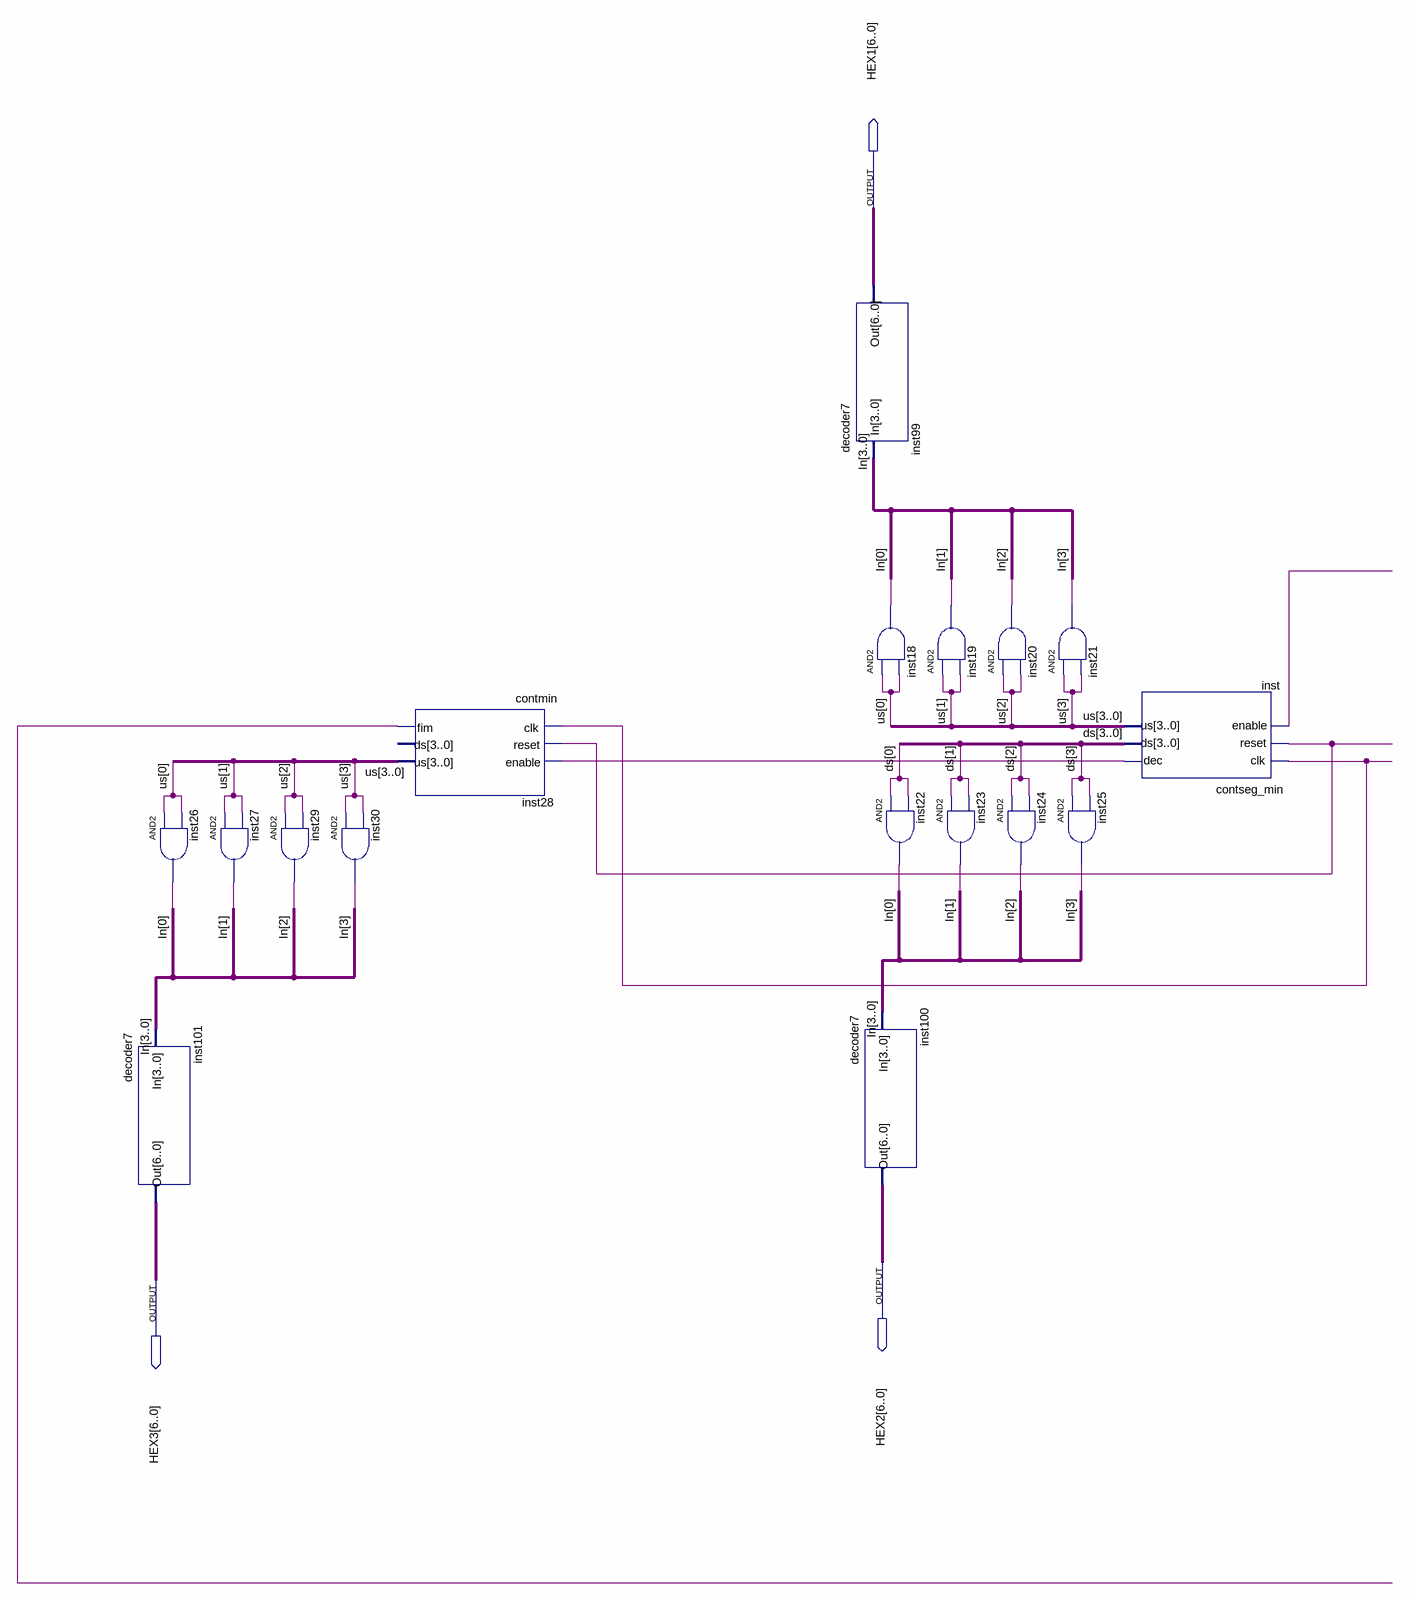
[diagram p0: schematic sheet]
// Quartus schematic a_outra_parte.bdf as structural Verilog: 17 symbols, 3 pins
module a_outra_parte (
  output [6:0] HEX1,
  output [6:0] HEX2,
  output [6:0] HEX3
);

  wire inst28_fim, inst_dec, undriven, undriven_2, undriven_3;
  wire [3:0] ds, In, us;

  and inst26 (In[0], us[0], us[0]);
  decoder7 inst101 (.In(In), .Out(HEX3));
  and inst27 (In[1], us[1], us[1]);
  and inst29 (In[2], us[2], us[2]);
  and inst30 (In[3], us[3], us[3]);
  contmin inst28 (.clk(undriven_3), .reset(undriven_2), .enable(inst_dec), .fim(inst28_fim), .us(us));  // open: ds
  decoder7 inst99 (.In(In), .Out(HEX1));
  and inst18 (In[0], us[0], us[0]);
  and inst22 (In[0], ds[0], ds[0]);
  decoder7 inst100 (.In(In), .Out(HEX2));
  and inst19 (In[1], us[1], us[1]);
  and inst23 (In[1], ds[1], ds[1]);
  and inst20 (In[2], us[2], us[2]);
  and inst21 (In[3], us[3], us[3]);
  and inst24 (In[2], ds[2], ds[2]);
  and inst25 (In[3], ds[3], ds[3]);
  contseg_min inst (.clk(undriven_3), .reset(undriven_2), .enable(undriven), .dec(inst_dec), .ds(ds), .us(us));
endmodule
